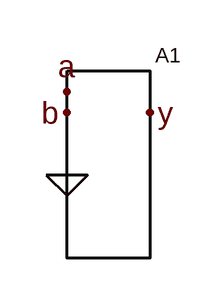
[diagram p0: schematic adevice_open_pin.asc]
adevice_open_pin.asc, the LTspice schematic file:
Version 4
SHEET 1 880 680
FLAG 64 64 a
FLAG 64 80 b
FLAG 64 128 0
FLAG 128 80 y
SYMBOL a8 96 64 R0
SYMATTR InstName A1

The netlist it stands for:
* adevice_open_pin.asc
A1 a b 0 0 0 0 y 0 AND
.backanno
.end